# Altium project Adit's_STM.PrjPcb
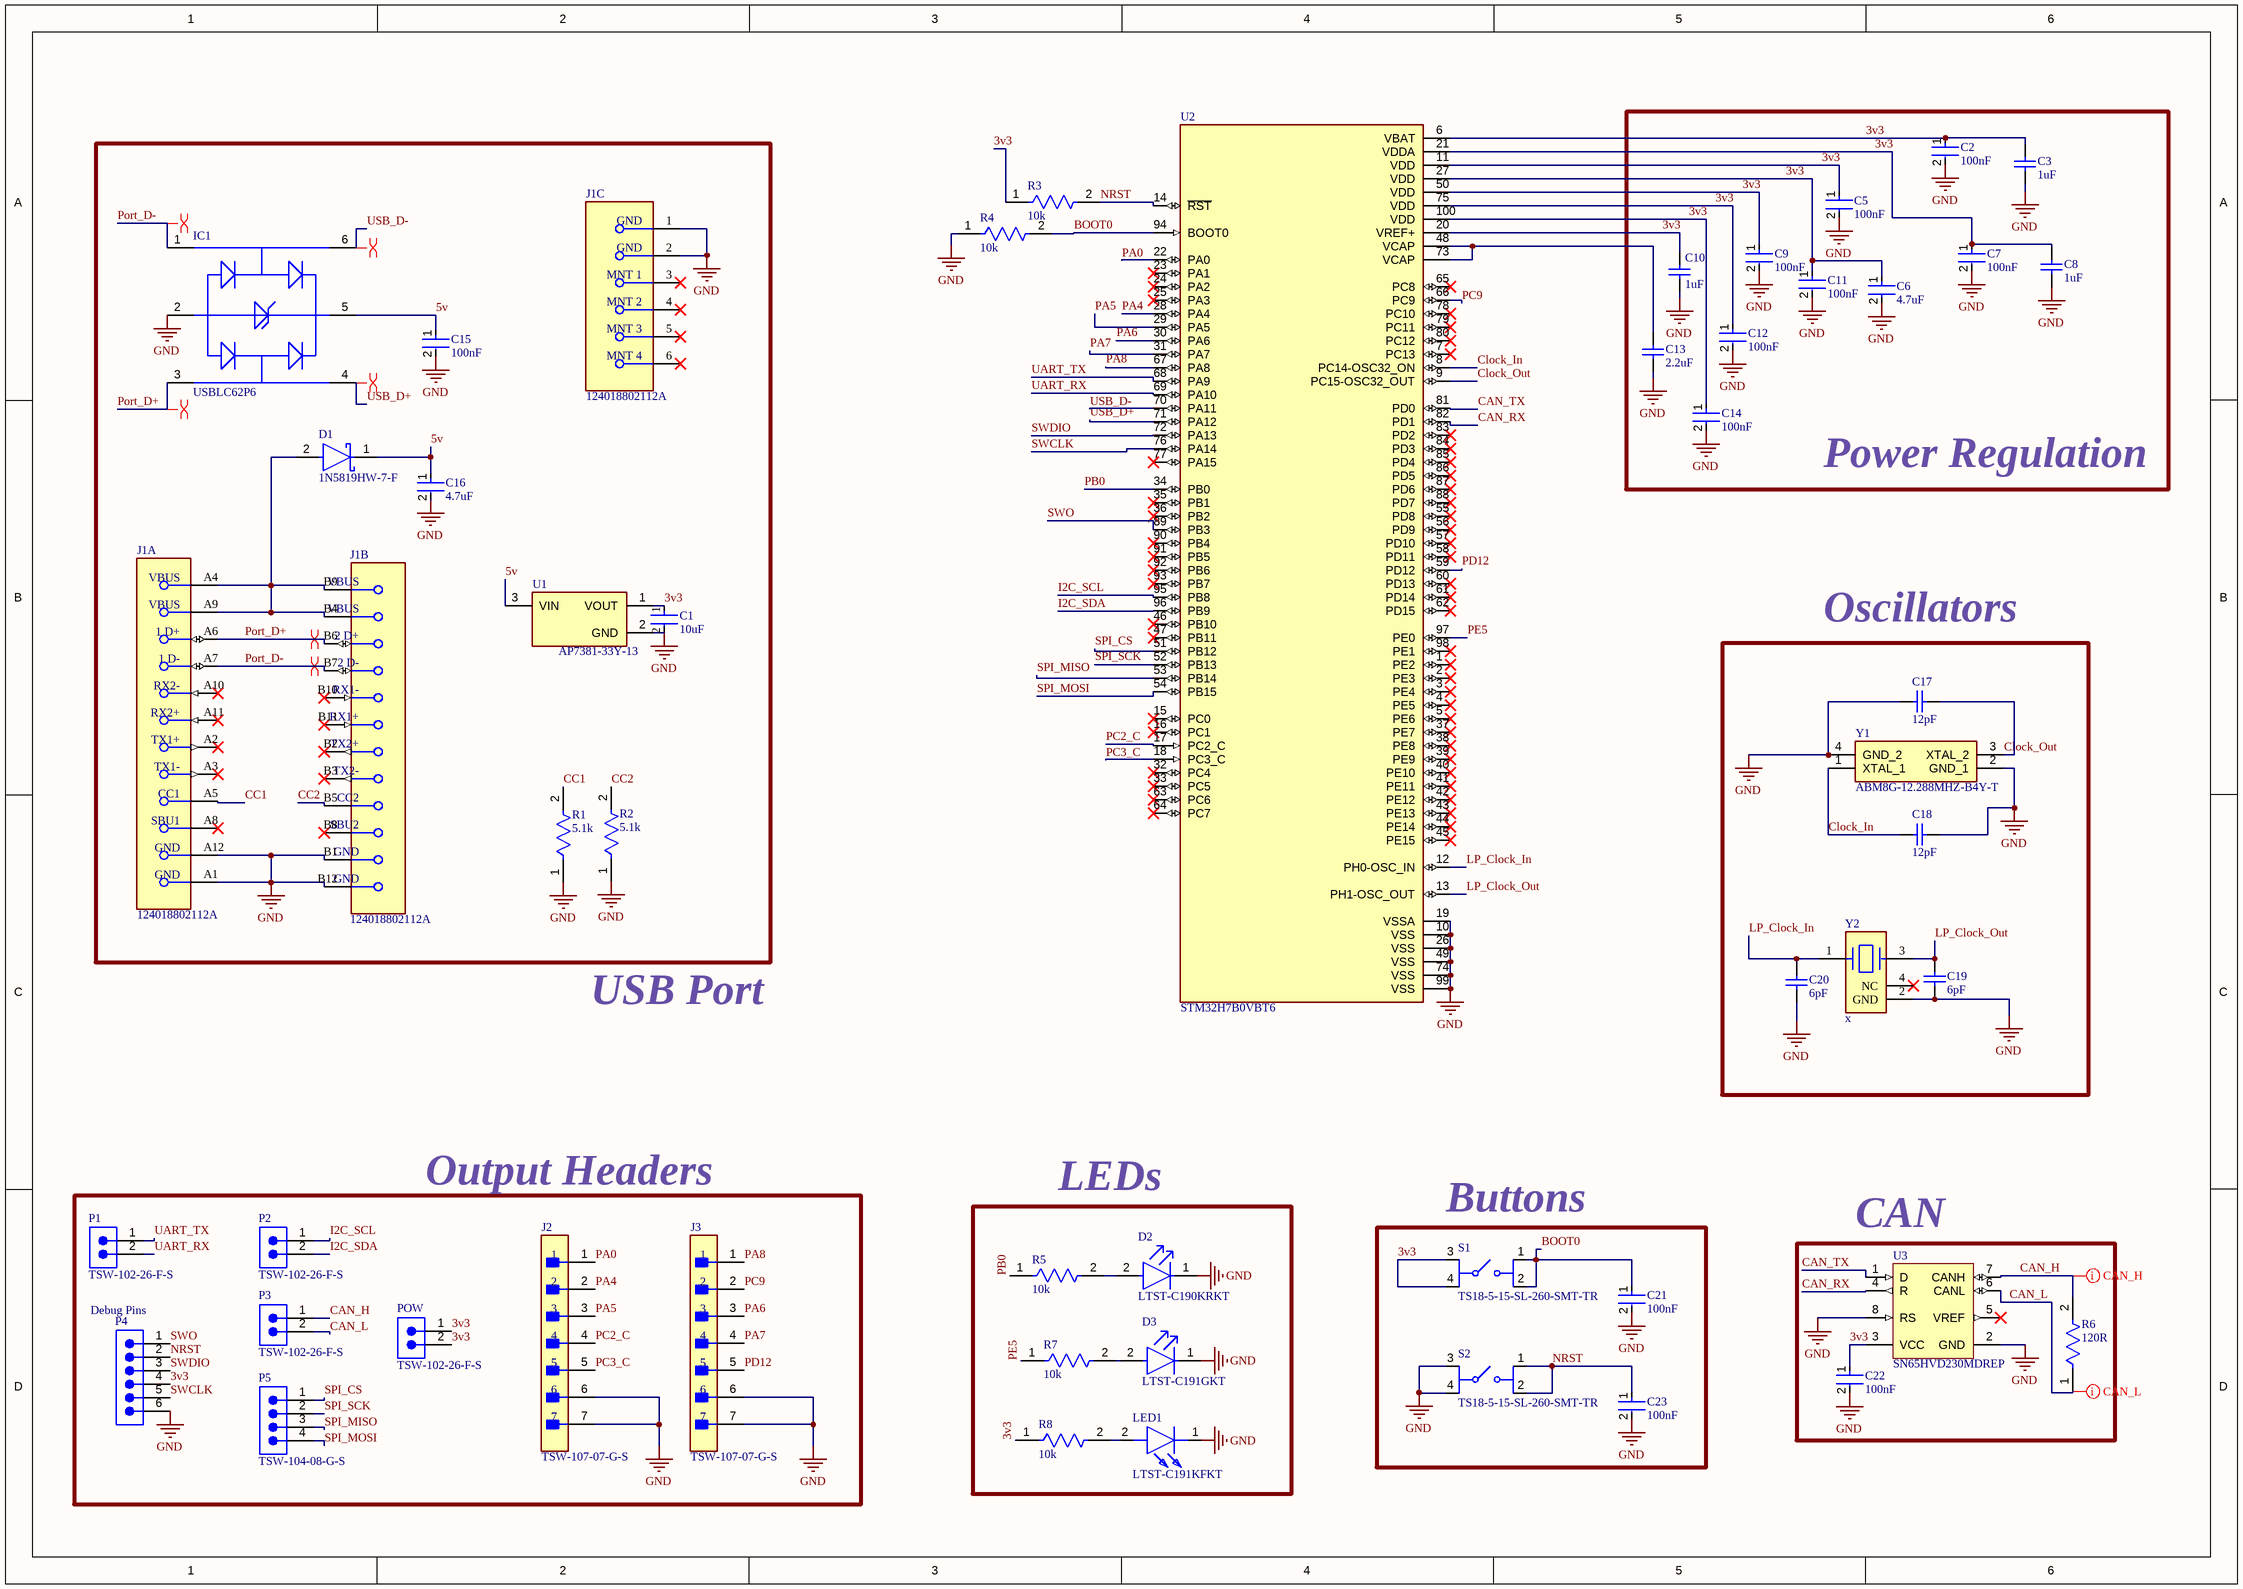
[diagram p0: Sheet1.SchDoc]
1 sheet, 51 parts. Net scope: global (net labels, ports and power ports of the same name join across sheets).
Board file: PCB1.PcbDoc

## Sheet Sheet1.SchDoc
size 420 x 297 mm; Author: Adit Bhatia; CompanyName: Formula Manipal; SheetNumber: 1; SheetTotal: 1

### Parts
C1  10uF  [FP-C0805C106K4PACTU-MFG]
C2  100nF  [FP-GCD21B-0_15-MFG]
C3  1uF  [CAPC2013X140X50NL20T25]
C5  100nF  [FP-GCD21B-0_15-MFG]
C6  4.7uF  [FP-GRM21B-0_15-IPC_A]
C7  100nF  [FP-GCD21B-0_15-MFG]
C8  1uF  [CAPC2013X140X50NL20T25]
C9  100nF  [FP-GCD21B-0_15-MFG]
C10  1uF  [CAPC2013X140X50NL20T25]
C11  100nF  [FP-GCD21B-0_15-MFG]
C12  100nF  [FP-GCD21B-0_15-MFG]
C13  2.2uF  [CAPC2013X152X50NL20T25]
C14  100nF  [FP-GCD21B-0_15-MFG]
C15  100nF  [FP-GCD21B-0_15-MFG]
C16  4.7uF  [FP-GRM21B-0_15-IPC_A]
C17  12pF  [CAPC0805(2012)100_L]
C18  12pF  [CAPC0805(2012)100_L]
C19  6pF  [CAPC2013X94X50LL20T25]
C20  6pF  [CAPC2013X94X50LL20T25]
C21  100nF  [FP-GCD21B-0_15-MFG]
C22  100nF  [FP-GCD21B-0_15-MFG]
C23  100nF  [FP-GCD21B-0_15-MFG]
D1  1N5819HW-7-F  [FP-SOD123-IPC_A]
D2  LTST-C190KRKT  [FP-LTST-C190KRKT-MFG]
D3  LTST-C191GKT  [FP-LTST-C191GKT-MFG]
IC1  USBLC62P6  [USBLC62P6]
J1  124018802112A  [FP-124018802112A-MFG]  (parts A,B,C of 3)
J2  TSW-107-07-G-S  [FP-TSW-107-07-G-S-MFG]
J3  TSW-107-07-G-S  [FP-TSW-107-07-G-S-MFG]
LED1  LTST-C191KFKT  [LEDC1608X55N]
P1  TSW-102-26-F-S  [SMTC-TSW-102-26-XX-S]
P2  TSW-102-26-F-S  [SMTC-TSW-102-26-XX-S]
P3  TSW-102-26-F-S  [SMTC-TSW-102-26-XX-S]
P4  Debug Pins  [SMTC-TSW-106-23-X-S]
P5  TSW-104-08-G-S  [SMTC-TSW-104-08-X-S]
POW  TSW-102-26-F-S  [SMTC-TSW-102-26-XX-S]
R1  5.1k  [FP-RT0805-MFG]
R2  5.1k  [FP-RT0805-MFG]
R3  10k  [FP-CRGCQ0805-IPC_C]
R4  10k  [FP-CRGCQ0805-IPC_C]
R5  10k  [FP-CRGCQ0805-IPC_C]
R6  120R  [FP-AC0805-MFG]
R7  10k  [FP-CRGCQ0805-IPC_C]
R8  10k  [FP-CRGCQ0805-IPC_C]
S1  TS18-5-15-SL-260-SMT-TR  [TS18515SL260SMTTR]
S2  TS18-5-15-SL-260-SMT-TR  [TS18515SL260SMTTR]
U1  AP7381-33Y-13  [FP-SOT89-MFG]
U2  STM32H7B0VBT6  [QFP50P1600X1600X160-100N]
U3  SN65HVD230MDREP  [D0008A_L]
Y1  ABM8G-12.288MHZ-B4Y-T  [ABM8G]
Y2  x  [FP-ABS04W-MFG]

### Blocks framed on the sheet
Power Regulation: C2 C3 C5-C14
Oscillators: C17-C20 Y1 Y2
Output Headers: J2 J3 P1-P5 POW
LEDs: D2 D3 LED1 R5 R7 R8
Buttons: C21 C23 S1 S2
CAN: C22 R6 U3

### Nets
GND: C1.2 C2.2 C3.1 C5.2 C6.2 C7.2 C8.1 C9.2 C10.1 C11.2 C12.2 C13.1 C14.2 C15.2 C16.2 C17.1 C18.2 C19.1 C20.1 C21.2 C22.2 C23.2 D2.1(C) D3.1(C) IC1.2(GND) J1.1(GND) J1.2(GND) J1.A1(GND) J1.A12(GND) J1.B1(GND) J1.B12(GND) J2.6 J2.7 J3.6 J3.7 LED1.1(K) P4.6 R1.1 R2.1 R4.1 S2.3(COM_1) S2.4(COM_2) U1.2(GND) U2.10(VSS) U2.19(VSSA) U2.26(VSS) U2.49(VSS) U2.74(VSS) U2.99(VSS) U3.2(GND) U3.8(RS) Y1.2(GND_1) Y1.4(GND_2) Y2.2(GND)
3v3: C1.1 C2.1 C3.2 C5.1 C6.1 C7.1 C8.2 C9.1 C10.2 C11.1 C12.1 C14.1 C22.1 P4.4 POW.1 POW.2 R3.1 R8.1 S1.3(COM_1) S1.4(COM_2) U1.1(VOUT) U2.6(VBAT) U2.11(VDD) U2.20(VREF+) U2.21(VDDA) U2.27(VDD) U2.50(VDD) U2.75(VDD) U2.100(VDD) U3.3(VCC)
5v: C15.1 C16.1 D1.1(C) IC1.5(VBUS) U1.3(VIN)
BOOT0: C21.1 R4.2 S1.1(NO_1) S1.2(NO_2) U2.94(BOOT0)
CAN_H: P3.1 R6.2 U3.7(CANH)
CAN_L: P3.2 R6.1 U3.6(CANL)
CAN_RX: U2.82(PD1) U3.4(R)
CAN_TX: U2.81(PD0) U3.1(D)
CC1: J1.A5(CC1) R1.2
CC2: J1.B5(CC2) R2.2
Clock_In: C18.1 U2.8(PC14-OSC32_ON) Y1.1(XTAL_1)
Clock_Out: C17.2 U2.9(PC15-OSC32_OUT) Y1.3(XTAL_2)
I2C_SCL: P2.1 U2.95(PB8)
I2C_SDA: P2.2 U2.96(PB9)
LP_Clock_In: C20.2 U2.12(PH0-OSC_IN) Y2.1
LP_Clock_Out: C19.2 U2.13(PH1-OSC_OUT) Y2.3
NRST: C23.1 P4.2 R3.2 S2.1(NO_1) S2.2(NO_2) U2.14(~{RST})
PA0: J2.1 U2.22(PA0)
PA4: J2.2 U2.28(PA4)
PA5: J2.3 U2.29(PA5)
PA6: J3.3 U2.30(PA6)
PA7: J3.4 U2.31(PA7)
PA8: J3.1 U2.67(PA8)
PB0: R5.1 U2.34(PB0)
PC2_C: J2.4 U2.17(PC2_C)
PC3_C: J2.5 U2.18(PC3_C)
PC9: J3.2 U2.66(PC9)
PD12: J3.5 U2.59(PD12)
PE5: R7.1 U2.97(PE0)
Port_D+: IC1.3(I/O2_1) J1.A6(1_D+) J1.B6(2_D+)
Port_D-: IC1.1(I/O1_1) J1.A7(1_D-) J1.B7(2_D-)
SPI_CS: P5.1 U2.51(PB12)
SPI_MISO: P5.3 U2.53(PB14)
SPI_MOSI: P5.4 U2.54(PB15)
SPI_SCK: P5.2 U2.52(PB13)
SWCLK: P4.5 U2.76(PA14)
SWDIO: P4.3 U2.72(PA13)
SWO: P4.1 U2.89(PB3)
UART_RX: P1.2 U2.69(PA10)
UART_TX: P1.1 U2.68(PA9)
USB_D+: IC1.4(I/O2_2) U2.71(PA12)
USB_D-: IC1.6(I/O1_2) U2.70(PA11)
NetC13_2: C13.2 U2.48(VCAP) U2.73(VCAP)
NetD1_2: D1.2(A) J1.A4(VBUS) J1.A9(VBUS) J1.B4(VBUS) J1.B9(VBUS)
NetD2_2: D2.2(A) R5.2
NetD3_2: D3.2(A) R7.2
NetLED1_2: LED1.2(A) R8.2

Not connected (* = marked no-connect by the designer): J1 3(MNT_1)* 4(MNT_2)* 5(MNT_3)* 6(MNT_4)* A2(TX1+)* A3(TX1-)* A8(SBU1)* A10(RX2-)* A11(RX2+)* B2(TX2+)* B3(TX2-)* B8(SBU2)* B10(RX1-)* B11(RX1+)*; U2 1(PE2)* 2(PE3)* 3(PE4)* 4(PE5)* 5(PE6)* 7(PC13)* 15(PC0)* 16(PC1)* 23(PA1)* 24(PA2)* 25(PA3)* 32(PC4)* 33(PC5)* 35(PB1)* 36(PB2)* 37(PE7)* 38(PE8)* 39(PE9)* 40(PE10)* 41(PE11)* 42(PE12)* 43(PE13)* 44(PE14)* 45(PE15)* 46(PB10)* 47(PB11)* 55(PD8)* 56(PD9)* 57(PD10)* 58(PD11)* 60(PD13)* 61(PD14)* 62(PD15)* 63(PC6)* 64(PC7)* 65(PC8)* 77(PA15)* 78(PC10)* 79(PC11)* 80(PC12)* 83(PD2)* 84(PD3)* 85(PD4)* 86(PD5)* 87(PD6)* 88(PD7)* 90(PB4)* 91(PB5)* 92(PB6)* 93(PB7)* 98(PE1)*; U3 5(VREF)*; Y2 4(NC)*

### Layout directives
differential pair: CAN_H, CAN_L, Port_D+, Port_D-, USB_D+, USB_D-

### Notes on the sheet
- USB Port
- THIS DOCUMENT AND THE DATA DISCLOSED HEREIN OR
- HEREWITH IS THE PROPERTY OF ALTIUM LIMITED AND MAY
- DWG NO:
- REVISION
- REV:
- DESCRIPTION
- DATE
- APPROVED
- BE FREELY DISTRIBUTED IN WHOLE. NO RIGHTS ARE
- RESERVED OR EXPRESS OR IMPLIED WARANTEE GIVEN.
- ENG:
- APPROVALS
- PROJECT
- DSN:
- CHK:
- REFERENCE DOCUMENTS
- PROJECT REVISION:
- TITLE
- DOCUMENT REVISION:
- DESIGN ITEM:
- BOM:
- FAB DWG:
- PCB DWG:
- ASSY DWG:
- SCALE:
- A3
- SIZE
- CAGE CODE
- FILE NAME
- DWG NO.
- SHEET
- OF
- REV

### Library data of the parts
C1 = CMP-03020-034671-1: CAP CER 10UF 16V X5R 0805; Dissipation Factor: 5%; Tolerance: 10%; Dielectric Material: Ceramic; REACH SVHC: No SVHC; Packaging: Tape and Reel; Series: C; Min Operating Temperature: -55°C; Construction: Flat; Radiation Hardening: No; Case Code (Metric): 2012; Contact Plating: Tin; Case Code (Imperial): 0805; Voltage Rating: 16V; Mount: Surface Mount; Width: 0.049inch; Voltage: 16V; Dielectric: X5R; Height: 1.25mm; Depth: 1.25mm; Case/Package: 0805; Max Operating Temperature: 85°C; Length: 2mm; Thickness: 0.055inch; Termination: SMD/SMT; Capacitance: 10uF; Number of Pins: 2; Voltage Rating (DC): 16V; Lead Free: Lead Free; Package Quantity: 1
C2 C5 C7 C9 C11 C12 C14 C15 C21-C23 = CMP-06035-062053-1: Chip Multilayer Ceramic Capacitors for Automotive, 0805, 0.10uF, X7R, 15%, 20%, 100V, Grade 1
C3 C8 C10 = CMP-2007-04663-1: Part Number: 0805YD105MAT2A; Manufacturer: AVX Interconnect / Elco
C6 C16 = CMP-06035-033280-1: Chip Multilayer Ceramic Capacitors for General Purpose, 0805, 4.7uF, X6S, 22%, 20%, 35V; Length: 2mm; Dielectric: X6S; Width: 1.25mm; Capacitance: 4.7uF; Case/Package: 0805; Tolerance: 20%; Voltage Rating (DC): 35V; Thickness: 1.25mm
C13 = CMP-2007-04517-1: Part Number: 0805YC225KAT2A; Manufacturer: AVX Interconnect / Elco
C17 C18 = CMP-1036-00968-1: CAP 12pF 100V ±10% 0805 (2012 Metric) Thickness 1mm SMD; Case-EIA: 0805; Tolerance: Â±10%; Case-Metric: 2012; Max Thickness: 1 mm; Technology: SMT; Value: 12pF; Rated Voltage: 100 V
C19 C20 = CMP-2007-04344-1: Manufacturer: AVX Interconnect / Elco; Part Number: 08055A6R0CAT2A
D1 = CMP-0303-00003-3: DIODE SCHOTTKY 40V 1A SOD123; Forward Voltage: 450mV; Capacitance: 110pF; Max Forward Surge Current (Ifsm): 25A; Peak Reverse Current: 50uA; Polarity: Standard; Element Configuration: Single; Max Power Dissipation: 450mW; Min Operating Temperature: -65°C; Package Quantity: 3000; Contact Plating: Tin; Weight: 0.000353oz; Max Repetitive Reverse Voltage (Vrrm): 40V; Max Reverse Voltage (DC): 40V; Height: 1.25mm; Average Rectified Current: 1A; Width: 1.7mm; Case/Package: SOD-123-2; Lead Free: Lead Free; Max Operating Temperature: 125°C; Current Rating: 1A; Termination: SMD/SMT; Forward Current: 1A; Radiation Hardening: No; Number of Pins: 2; Length: 2.85mm; Voltage Rating (DC): 40V; REACH SVHC: No SVHC; Peak Non-Repetitive Surge Current: 25A; Packaging: Tape and Reel; Output Current: 1A
D2 = CMP-1674-00011-2: LED RED CLEAR CHIP SMD; Reverse Voltage: 5V; Viewing Angle: 130°; Power Rating: 75mW; Test Current: 20mA; Number of Elements: 1; Lens Color: Colorless; Wavelength: 639nm; Dominant Wavelength: 631nm; Lens Style: Diffused; Forward Current: 30mA; Forward Voltage: 2.4V; Luminous Intensity: 54mcd; Color: Red; Case Code (Imperial): 0603; Lens Transparency: Clear; Lead Free: Lead Free; Package Quantity: 1; Packaging: Tape and Reel; Max Operating Temperature: 85°C; Number of Pins: 2; Height: 0.8mm; Case/Package: 0603; Number of LEDs: 1; Width: 0.8mm; Case Code (Metric): 1608; Depth: 0.8mm; Mount: Surface Mount; Radiation Hardening: No; Length: 1.6mm; Illumination Color: Red; Power Dissipation: 75mW; Min Operating Temperature: -55°C
D3 = CMP-22017-000029-1: LED GREEN CLEAR CHIP SMD; Power Dissipation: 100mW; Lens Color: Colorless; Number of Elements: 1; Dominant Wavelength: 569nm; Forward Voltage: 2.1V; Forward Current: 30mA; Test Current: 20mA; Viewing Angle: 130°; Wavelength: 565nm; Luminous Intensity: 12mcd; Reverse Voltage: 5V; Case/Package: 0603; Package Quantity: 1; Illumination Color: Green; Lens Style: Clear; Lens Transparency: Clear; Depth: 0.8mm; Power Rating: 100mW; Width: 0.8mm; Height: 0.55mm; Radiation Hardening: No; Case Code (Imperial): 0603; Number of Pins: 2; Length: 1.6mm; Case Code (Metric): 1608; Max Operating Temperature: 85°C; Color: Green; Packaging: Tape and Reel; Mount: Surface Mount; Min Operating Temperature: -55°C; Lead Free: Lead Free; Number of LEDs: 1
IC1 = USBLC62P6: Integrated Circuit; Manufacturer_Name: STMicroelectronics; Datasheet Link: https://datasheet.lcsc.com/szlcsc/STMicroelectronics-USBLC6-2P6_C15999.pdf; Height: 0.6mm; Manufacturer_Part_Number: USBLC62P6
J1 = CMP-02355-000005-1: USB TYPE C, RECEPTACLE, TOP MOUN
J2 J3 = CMP-02766-000065-1: CONN HEADER VERT 7POS 2.54MM; Manufacturer: SAMTEC; Conn Orientation: Straight; Number Of Contacts: 7; Conn Gender: Male; Lead Free: Yes; Automotive: No; Temperature Range High: +125°C; Pitch: 2.54mm; Footprint Url: http://suddendocs.samtec.com/prints/tsw-xxx-xx-x-x-xx-xxx-footprint.pdf; Device Class L1: Connectors; Contact Material: Gold,Nickel; RoHS: TRUE; ComponentLink2URL: http://suddendocs.samtec.com/prints/tsw-xxx-xx-xxx-x-xx-xxx-mkt.pdf; Manufacturer Part Number: TSW-107-07-G-S; Octopart: https://octopart.com/tsw-107-07-g-s-samtec-272202; Digikey Description: CONN HEADER VERT 7POS 2.54MM; Number Of Rows: 1; Temperature Range Low: -55°C; Device Class L2: Headers and Wire Housings; ComponentLink2Description: Datasheet; Category: Conn; Device Class L3: unset; Mouser Description: Conn Unshrouded Header HDR 7 POS 2.54mm Solder ST Thru-Hole Automotive Bulk; Temperature: -55°C to +125°C; Height: 8.71mm; Package: 0
LED1 = LTST-C191KFKT: LED; Manufacturer_Name: Lite-On; Datasheet Link: https://datasheet.datasheetarchive.com/originals/distributors/Datasheets-305/79307.pdf; Height: 0.55mm; Manufacturer_Part_Number: LTST-C191KFKT; Mouser Part Number: 859-LTST-C191KFKT; Mouser Price/Stock: https://www.mouser.co.uk/ProductDetail/Lite-On/LTST-C191KFKT?qs=1bx9pL%2Fk%252BiAv01YAc0eitQ%3D%3D; Arrow Part Number: LTST-C191KFKT; Arrow Price/Stock: https://www.arrow.com/en/products/ltst-c191kfkt/lite-on-technology.html?utm_currency=USD&region=nac
P1-P3 POW = CMP-1024-00329-1: 0.025" SQ Post Header, Through-hole, Vertical, -55 to 125 degC, 2.54 mm Pitch, 2-Pin, Male, RoHS; Manufacturer: Samtec; Pitch: 2.54 mm; PackageVersion: DM, 8/1988; ComponentLink2Description: Datasheet; PackageReference: TSW-102-26-XX-S; ComponentLink3URL: http://www.samtec.com/documents/webfiles/cpdf/TSW-XXX-XX-XXX-X-XX-XXX-MKT.pdf; ComponentLink2URL: http://www.samtec.com/documents/webfiles/pdf/TSW_TH.PDF; ComponentLink1Description: Manufacturer URL; DatasheetVersion: F-214; RoHS: True; ComponentLink3Description: Package Specification; PartNumber: TSW-102-26-F-S; Temperature Range: -55 to 125 degC; Orientation: Vertical; ComponentLink1URL: http://www.samtec.com; PackageDescription: .025[0.64] SQ. Post Terminal Strip Assembly; Mounting Technology: Through-hole
P4 = CMP-1024-00396-1: 0.025" SQ Post Header, Through-hole, Vertical, -55 to 125 degC, 2.54 mm Pitch, 6-Pin, Male, RoHS; PartNumber: TSW-106-23-G-S; Manufacturer: Samtec; Pitch: 2.54 mm; Orientation: Vertical; Mounting Technology: Through-hole; RoHS: True; PackageVersion: DM, 8/1988; ComponentLink3Description: Package Specification; PackageDescription: .025[0.64] SQ. Post Terminal Strip Assembly; ComponentLink2URL: http://www.samtec.com/documents/webfiles/pdf/TSW_TH.PDF; Temperature Range: -55 to 125 degC; PackageReference: TSW-106-23-X-S; ComponentLink1Description: Manufacturer URL; ComponentLink2Description: Datasheet; ComponentLink3URL: http://www.samtec.com/documents/webfiles/cpdf/TSW-XXX-XX-XXX-X-XX-XXX-MKT.pdf; DatasheetVersion: F-214; ComponentLink1URL: http://www.samtec.com
P5 = CMP-1024-00357-1: 0.025" SQ Post Header, Through-hole, Vertical, -55 to 125 degC, 2.54 mm Pitch, 4-Pin, Male, RoHS; Manufacturer: Samtec; Pitch: 2.54 mm; RoHS: True; ComponentLink3URL: http://www.samtec.com/documents/webfiles/cpdf/TSW-XXX-XX-XXX-X-XX-XXX-MKT.pdf; Mounting Technology: Through-hole; ComponentLink2URL: http://www.samtec.com/documents/webfiles/pdf/TSW_TH.PDF; ComponentLink1URL: http://www.samtec.com; ComponentLink3Description: Package Specification; PackageVersion: DM, 8/1988; ComponentLink2Description: Datasheet; PackageReference: TSW-104-08-X-S; PackageDescription: .025[0.64] SQ. Post Terminal Strip Assembly; PartNumber: TSW-104-08-G-S; ComponentLink1Description: Manufacturer URL; Temperature Range: -55 to 125 degC; DatasheetVersion: F-214; Orientation: Vertical
R1 R2 = CMP-2001-01553-2: RES SMD 5.1K OHM 0.1% 1/8W 0805; Manufacturer: Yageo; Manufacturer Part Number: RT0805BRD075K1L; Value: 5.1KΩ; Voltage Rating: 150V; Power Rating: 0.125W; Temperature Coefficient: 25 ppm/°C; Tolerance: 0.0025; Footprint Url: http://www.yageo.com/exep/pages/download/literatures/PYu-R_Mount_10.pdf; Digikey Description: RES SMD 5.1K OHM 0.1% 1/8W 0805; Device Class L2: Resistors; Resistance: 5.1KΩ; Temperature Range Low: -55°C; Automotive: No; Lead Free: Yes; Composition: Thin Film; Octopart: https://octopart.com/rt0805brd075k1l-yageo-1209369; Temperature Range High: +155°C; RoHS: TRUE; Mouser Description: Res Thin Film 0805 5.1K Ohm 0.1% 1/8W ±10ppm/°C Molded SMD Paper T/R; ComponentLink2URL: http://www.yageo.com/documents/recent/PYu-RT_1-to-0.01_RoHS_L_9.pdf; Category: Res; Device Class L3: Chip SMD Resistors; ComponentLink2Description: Datasheet; Height: 0.6mm; Device Class L1: Passive Components; Package: RT0805; Temperature: -55°C to +155°C; Ipc Land Pattern Name: RESC200125X50; Series: RT
R3-R5 R7 R8 = CMP-03211-002989-1: CRGCQ 0805 10K 5%; Manufacturer Part Number: CRGCQ0805J10K; Manufacturer: TE Connectivity; Voltage Rating: 150V; Temperature Coefficient: ±100ppm/°C; Resistance: 10KΩ; Value: 10KΩ; Power Rating: 0.125W; Tolerance: 0.05; Automotive Grade: Grade 914; Height: 0.65mm; Lead Free: Yes; Temperature Range High: +155°C; Composition: Thick Film; Temperature Range Low: -55°C; Ambient Temperature Range High: +70°C; Temperature: -55°C to +155°C; Package: CRGCQ0805; Device Class L2: Resistors; RoHS: TRUE; ComponentLink2URL: https://www.te.com/commerce/DocumentDelivery/DDEController?Action=showdoc&DocId=Data+Sheet%7F1773204-3%7F1%7Fpdf%7FEnglish%7FENG_DS_1773204-3_1.pdf%7F4-2176341-923; Series: CRGCQ; Device Class L1: Passive Components; Ipc Land Pattern Name: RESC200125X55; ComponentLink2Description: Datasheet; Category: Res; Digikey Description: CRGCQ 0805 10K 5%; Mouser Description: Res Thick Film 0805 10K Ohm 5% 0.125W(1/8W) ±100ppm/C Pad SMD Automotive T/R; Automotive: Yes; Octopart: https://octopart.com/crgcq0805j10k-te+connectivity-91018201; Device Class L3: Chip SMD Resistors
R6 = CMP-03412-037390-1: RES SMD 120 OHM 5% 1/8W 0805; Manufacturer: Yageo; Manufacturer Part Number: AC0805JR-07120RL; Value: 120Ω; Tolerance: 0.05; Automotive Grade: Grade 0; Voltage Rating: 150V; Ipc Land Pattern Name: RESC200125X50; Category: Res; RoHS: TRUE; Package: AC0805; Temperature Range High: +155°C; Device Class L2: Resistors; Temperature: -55°C to +155°C; Composition: Thick Film; Footprint Url: http://www.yageo.com/exep/pages/download/literatures/PYu-R_Mount_10.pdf; ComponentLink2URL: http://www.yageo.com/documents/recent/PYu-AC_51_RoHS_L_6.pdf; Device Class L1: Passive Components; Resistance: 120Ω; Height: 0.6mm; ComponentLink2Description: Datasheet; Octopart: https://octopart.com/ac0805jr-07120rl-yageo-52448213; Automotive: Yes; Digikey Description: RES SMD 120 OHM 5% 1/8W 0805; Temperature Range Low: -55°C; Lead Free: Yes; Device Class L3: Chip SMD Resistors; Series: AC; Power Rating: 1/8W; Mouser Description: Thick Film Resistors - SMD 1/8W 120ohm 5% AEC-Q200
S1 S2 = TS18-5-15-SL-260-SMT-TR: Switch (4-Pin Push); Manufacturer_Name: Same Sky; Datasheet Link: https://www.sameskydevices.com/product/resource/ts18.pdf; Height: 1.6mm; Manufacturer_Part_Number: TS18-5-15-SL-260-SMT-TR; Mouser Part Number: 179-TS18515SL260SMTT; Mouser Price/Stock: https://www.mouser.co.uk/ProductDetail/CUI-Devices/TS18-5-15-SL-260-SMT-TR?qs=tlsG%2FOw5FFh4WzqzrHrOOQ%3D%3D; Arrow Part Number: TS18-5-15-SL-260-SMT-TR; Arrow Price/Stock: https://www.arrow.com/en/products/ts18-5-15-sl-260-smt-tr/cui-devices?utm_currency=USD&region=nac
U1 = CMP-12756-000003-1: IC REG LINEAR 3.3V 150MA SOT89; Manufacturer: Diodes Inc.; Max Supply Voltage: 40V; Nominal Supply Current: 2.5-25uA; Max Junction Temp: +125°C; Number Of Outputs: 1; Output Type: Fixed; Dropout Voltage: 1000mV; Ambient Temperature Range High: +85°C; Temperature: -40°C to +125°C; Digikey Description: IC REG LINEAR 3.3V 150MA SOT89; Footprint Url: https://www.diodes.com/assets/Package-Files/SOT89.pdf; Output Voltage: 3.3V; Device Class L2: Power Management ICs; Device Class L1: Integrated Circuits (ICs); Lead Free: Yes; Automotive: No; Height: 1.6mm; Package: SOT89; Octopart: https://octopart.com/ap7381-33y-13-diodes+inc.-87775115; RoHS: TRUE; Output Current: 150mA; Temperature Range High: +125°C; Device Class L3: Voltage Regulators - Linear; Ambient Temperature Range Low: -40°C; Temperature Range Low: -40°C; Category: IC; ComponentLink2URL: https://www.diodes.com/assets/Datasheets/AP7381.pdf; ComponentLink2Description: Datasheet; Min Supply Voltage: 3.3V; Manufacturer Part Number: AP7381-33Y-13
U2 = CMP-010-000016-1: ARMÂ® CortexÂ®-M7 STM32H7 Microcontroller IC 32-Bit Single-Core 280MHz 128KB (128K x 8) FLASH 100-LQFP (14x14); MF: STMicroelectronics; MP: STM32H7B0VBT6; Source: STM32H7B0VBT6.SchLib; Component Type: Standard; SnapEDA_Link: https://www.snapeda.com/parts/STM32H7B0VBT6/STMicroelectronics/view-part/?ref=snap; Check_prices: https://www.snapeda.com/parts/STM32H7B0VBT6/STMicroelectronics/view-part/?ref=eda; Package: LQFP-100 STMicroelectronics; Pin Count: 100; Value: *; Design Item ID: STM32H7B0VBT6
U3 = CMP-0315-00052-2: Enhanced Product 3.3 V Can Transceiver with Standby Mode, 17 mA, -55 to 125 degC, 8-pin SOIC (D), Green (RoHS & no Sb/Br); Manufacturer: Texas Instruments; Supply Voltage(s)(V): 3.3; ICC(Max)(mA): 17; Receivers Per Package: 1; Transient Pulse Protection(V): -25 to 25; Rating: HiRel Enhanced Product; DatasheetVersion: SGLS356; Isolated: No; PackageDescription: 8-Pin Plastic Small Outline Integrated Circuit, 4.9 x 3.9 mm, Pitch 1.27 mm Pitch; Mounting Technology: Surface Mount; ComponentLink1Description: Datasheet; Low Power Mode: Standby; PackageVersion: revM, Jun-2011; SubFamily: CAN; ComponentLink1URL: http://www.ti.com/general/docs/lit/getliterature.tsp?genericPartNumber=SN65HVD230M-EP&fileType=pdf; Code_JEDEC: MS-012AA; Drivers Per Package: 1; Footprint: PCA82C250; PackageReference: D0008A; PartNumber: SN65HVD230MDREP; Eco-Plan: Green (RoHS & no Sb/Br)
Y1 = ABM8G-12.288MHZ-B4Y-T: Crystal or Oscillator; Manufacturer_Name: ABRACON; Datasheet Link: https://abracon.com/Resonators/ABM8G.pdf; Height: 1mm; Manufacturer_Part_Number: ABM8G-12.288MHZ-B4Y-T; Mouser Part Number: 815-ABM8G-12.2-B4Y-T; Mouser Price/Stock: https://www.mouser.com/Search/Refine.aspx?Keyword=815-ABM8G-12.2-B4Y-T; Arrow Part Number: ABM8G-12.288MHZ-B4Y-T; Arrow Price/Stock: https://www.arrow.com/en/products/abm8g-12.288mhz-b4y-t/abracon
Y2 = CMP-27762-014409-1: Crystal 32.768kHz ±20ppm (Tol) 6pF FUND 130kΩ 4-Pin SMD T/R; RoHS Compliant: Yes